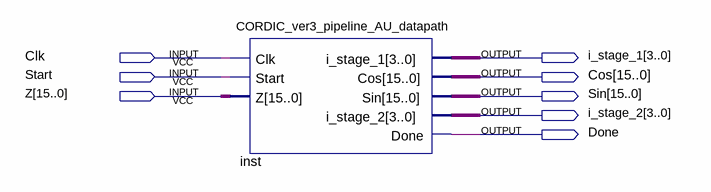
[diagram p0: schematic sheet]
// Quartus schematic CORDIC_ver3_pipeline_AU_datapath_test.bdf as structural Verilog: 1 symbols, 8 pins
module CORDIC_ver3_pipeline_AU_datapath_test (
  input  Clk,
  input  Start,
  input  [15:0] Z,
  output [3:0] i_stage_1,
  output [15:0] Cos,
  output [15:0] Sin,
  output [3:0] i_stage_2,
  output Done
);

  CORDIC_ver3_pipeline_AU_datapath inst (
    .Clk(Clk), .Start(Start), .Z(Z), .i_stage_1(i_stage_1), .Cos(Cos), .Sin(Sin), .i_stage_2(i_stage_2),
    .Done(Done));
endmodule
